# Altium schematic sheet USB.SchDoc
size A4; SheetNumber: 4; SheetTotal: 5
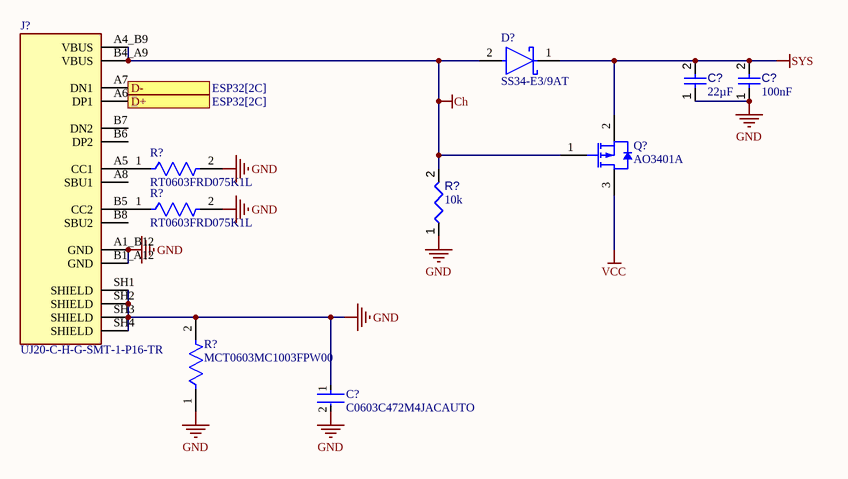
[diagram p0: USB.SchDoc]

## Parts
(Parts that share a designator on the sheet are numbered #1, #2 ... from top to bottom, then left to right.)
C?#1  value 22µF  [CAPC0805(2012)145_L]  (hidden comment: Capacitor 22µF +/-40% 16V 0805)
C?#2  value 100nF  [CAPC1608X90X40NL10T20]  (hidden comment: Capacitor 100 nF +/-10% 50 V 0603)
C?#3  C0603C472M4JACAUTO  [FP-C0603C-CF-MFG]
D?  SS34-E3/9AT  [FP-SMC-MFG]
J?  UJ20-C-H-G-SMT-1-P16-TR  [SAMESKY_UJ20-C-H-G-SMT-1-P16-TR]
Q?  AO3401A  [AO-SOT-23-3L_V]
R?#1  RT0603FRD075K1L  [FP-RT0603-MFG]
R?#2  RT0603FRD075K1L  [FP-RT0603-MFG]
R?#3  value 10k  [RESC2013X50X35ML15T15]  (hidden comment: Resistor 10k +/-1% 0805 125 mW)
R?#4  MCT0603MC1003FPW00  [FP-MCT0603-MFG]

## Ports
D+ (see ESP32[2C]), D- (see ESP32[2C])

## Nets
Ch: D?.2(A) J?.A4_B9(VBUS) J?.B4_A9(VBUS) Q?.1(GATE) R?#3.2
GND: C?#1.1 C?#2.1 C?#3.1 C?#3.2 J?.A1_B12(GND) J?.B1_A12(GND) J?.SH1(SHIELD) J?.SH2(SHIELD) J?.SH3(SHIELD) J?.SH4(SHIELD) R?#1.2 R?#2.2 R?#3.1 R?#4.1 R?#4.2
SYS: C?#1.2 C?#2.2 D?.1(C) Q?.2(SOURCE)
VCC: Q?.3(DRAIN)
D+: J?.A6(DP1) ; port D+
D-: J?.A7(DN1) ; port D-
NetJ?_A5: J?.A5(CC1) R?#1.1
NetJ?_B5: J?.B5(CC2) R?#2.1

Not connected (* = marked no-connect by the designer): J? A8(SBU1) B6(DP2) B7(DN2) B8(SBU2)

## Library data of the parts
C?#1 = CMP-001-00081-4: Chip Capacitor, 22µF +/-40%, 16V, 0805, Thickness 1.45 mm; Tolerance: 5%; Voltage Rating: 16V; Mounting Technology: SMT; Pins: 2; Max Operating Temperature: 85°C; Case/Package: 0805; Min Operating Temperature: -55°C
C?#2 = CMP-001-00017-6: Chip Capacitor, 100 nF, +/- 10%, 50 V, 0603 (1608 Metric); Voltage Rating: 50V; Capacitor Type: Ceramic; Tolerance: 10%; Mounting Technology: SM; Max Operating Temperature: 125°C; RoHS Compliant: True; Pins: 2; Case/Package: 0603; Min Operating Temperature: -55°C
C?#3 = CMP-03020-017508-1: C0603 4,700 pF U2J 30ppm/°C 20.00% 16 V; Manufacturer: KEMET; Automotive Grade: Grade 1; Voltage Rating: 16 V; Material: Ceramic; Tolerance: 0.2; Temperature: -55°C to +125°C; Temperature Characteristic: U2J; Temperature Range Low: -55°C; Temperature Range High: +125°C; ComponentLink2URL: https://api.kemet.com/component-edge/download/datasheet/C0603C100J5GACAUTO.pdf; Capacitance: 4,700 pF; Octopart: https://octopart.com/c0603c472m4jacauto-kemet-84731110; Device Class L1: Passive Components; ComponentLink2Description: Datasheet; Height: 0.87mm; Device Class L3: Ceramic Capacitors; RoHS: TRUE; Temperature Coefficient: 30ppm/°C; Automotive: Yes; Package: C0603C-CF; Value: 4,700 pF; Device Class L2: Capacitors; Category: Cap; Manufacturer Part Number: C0603C472M4JACAUTO; Lead Free: Yes
D? = CMP-02539-000066-1: DIODE SCHOTTKY 40V 3A DO214AB; Peak Non-Repetitive Surge Current: 100A; Forward Voltage: 500mV; Element Configuration: Single; Max Reverse Current: 500uA; Case/Package: SMC; Radiation Hardening: No; Series: -; Max Surge Current: 100A; RoHS Compliant: Yes; Min Operating Temperature: -55°C; Average Rectified Current: 3A; Max Reverse Leakage Current: 500uA; Package Quantity: 3500; Max Reverse Voltage (DC): 40V; Forward Current: 3A; Packaging: Tape and Reel; Max Operating Temperature: 125°C; Max Repetitive Reverse Voltage (Vrrm): 40V; Number of Pins: 2; Mount: Surface Mount
J? = UJ20-C-H-G-SMT-1-P16-TR: USB-C (USB TYPE-C) USB 2.0 Receptacle Connector 24 (16+8 Dummy) Position Surface Mount, Right Angle; Through Hole; MF: Same Sky; SnapEDA_Link: https://www.snapeda.com/parts/UJ20-C-H-G-SMT-1-P16-TR/Same+Sky/view-part/?ref=snap; Package: None; Value: *; MP: UJ20-C-H-G-SMT-1-P16-TR; Check_prices: https://www.snapeda.com/parts/UJ20-C-H-G-SMT-1-P16-TR/Same+Sky/view-part/?ref=eda
Q? = CMP-2000-05778-1: P-Channel MOSFET, 30 V, 4 A, -55 to 150 degC, 3-Pin SOT-23-3L, RoHS, Tape and Reel; Manufacturer: Alpha and Omega; Output Power (Max): NotRequiredW; Power Dissipation: 1.4W; Rad Hardened: No; Drain Efficiency: NotRequired%; Drain-Source On-Volt: 30V; Noise Figure: NotRequireddB; Frequency (Max): NotRequiredMHz; Number of  Elements: 1; Gate-Source Voltage (Max): ?12V; Drain Current (Max): 4A; Channel Mode: Enhancement; Drain-Source On-Res: 0.044ohm; Type: PowerMOSFET; Polarity: P; Package URL: http://www.aosmd.com/res/packaging_information/SOT-23-3L.pdf; Datasheet URL: http://www.aosmd.com/res/data_sheets/AO3401A.pdf; Package Type: SOT-23; Package Description: 3-Pin Small Outline Transistor, Body 2.95 x 1.6 mm, Pitch 0.95 mm; Mounting: SurfaceMount; Manufacturer URL: http://www.aosmd.com/; Continuous Drain Current: 4A; Package Reference: SOT-23-3L; Mounting Technology: SurfaceMount; Operating Temperature Classification: Military; Power Gain: NotRequireddB; Datasheet Version: Rev. 3, 03/2011; Operating Temp Range: -55Cto150C; Pin Count: 3
R?#1 R?#2 = CMP-03412-013541-1: RES SMD 5.1K OHM 1% 1/10W 0603; Manufacturer: Yageo; Value: 5.1KΩ; Temperature Coefficient: 25 ppm/°C; Power Rating: 0.1W; Voltage Rating: 75V; Tolerance: 0.01; Description: RT0603 5.1KΩ 0.1W 25 ppm/°C 1.00%; RoHS: TRUE; Height: 0.55mm; Ipc Land Pattern Name: RESC16080X45; Category: Res; Device Class L3: Chip SMD Resistors; ComponentLink2URL: http://www.yageo.com/documents/recent/PYu-RT_1-to-0.01_RoHS_L_9.pdf; Temperature: -55°C to +155°C; Resistance: 5.1KΩ; Digikey Description: RES SMD 5.1K OHM 1% 1/10W 0603; Temperature Range Low: -55°C; Footprint Url: http://www.yageo.com/exep/pages/download/literatures/PYu-R_Mount_10.pdf; Manufacturer Part Number: RT0603FRD075K1L; Series: RT; Composition: Thin Film; Temperature Range High: +155°C; Automotive: No; ComponentLink2Description: Datasheet; Device Class L2: Resistors; Lead Free: Yes; Octopart: https://octopart.com/rt0603frd075k1l-yageo-71395417; Package: RT0603; Device Class L1: Passive Components
R?#3 = CMP-009-00018-5: Chip Resistor, 10 KOhm, +/- 1%, 125 mW, -55 to 155 degC, 0805 (2012 Metric); Power: 125mW; Voltage Rating: 150V; Tolerance: 1%; Pins: 2; Min Operating Temperature: -55°C; Case/Package: 0805; Max Operating Temperature: 155°C; RoHS Compliant: True; Mounting Technology: SM
R?#4 = CMP-02407-009945-1: RES SMD 100 OHM 1% 1/8W 0603